# Altium schematic sheet LED_RESET_XCO.SchDoc
size 420 x 297 mm; Author: Лотов М.Д.; Address1: Address1; Address2: Address2; Address3: Address3; Address4: Address4; DocumentNumber: LED_RESET_XCO; SheetNumber: 5; SheetTotal: 5; Scale: 1:1; DocumentType: Схема электрическая принципиальная; FirstReferrence: АБВГ.123456.001
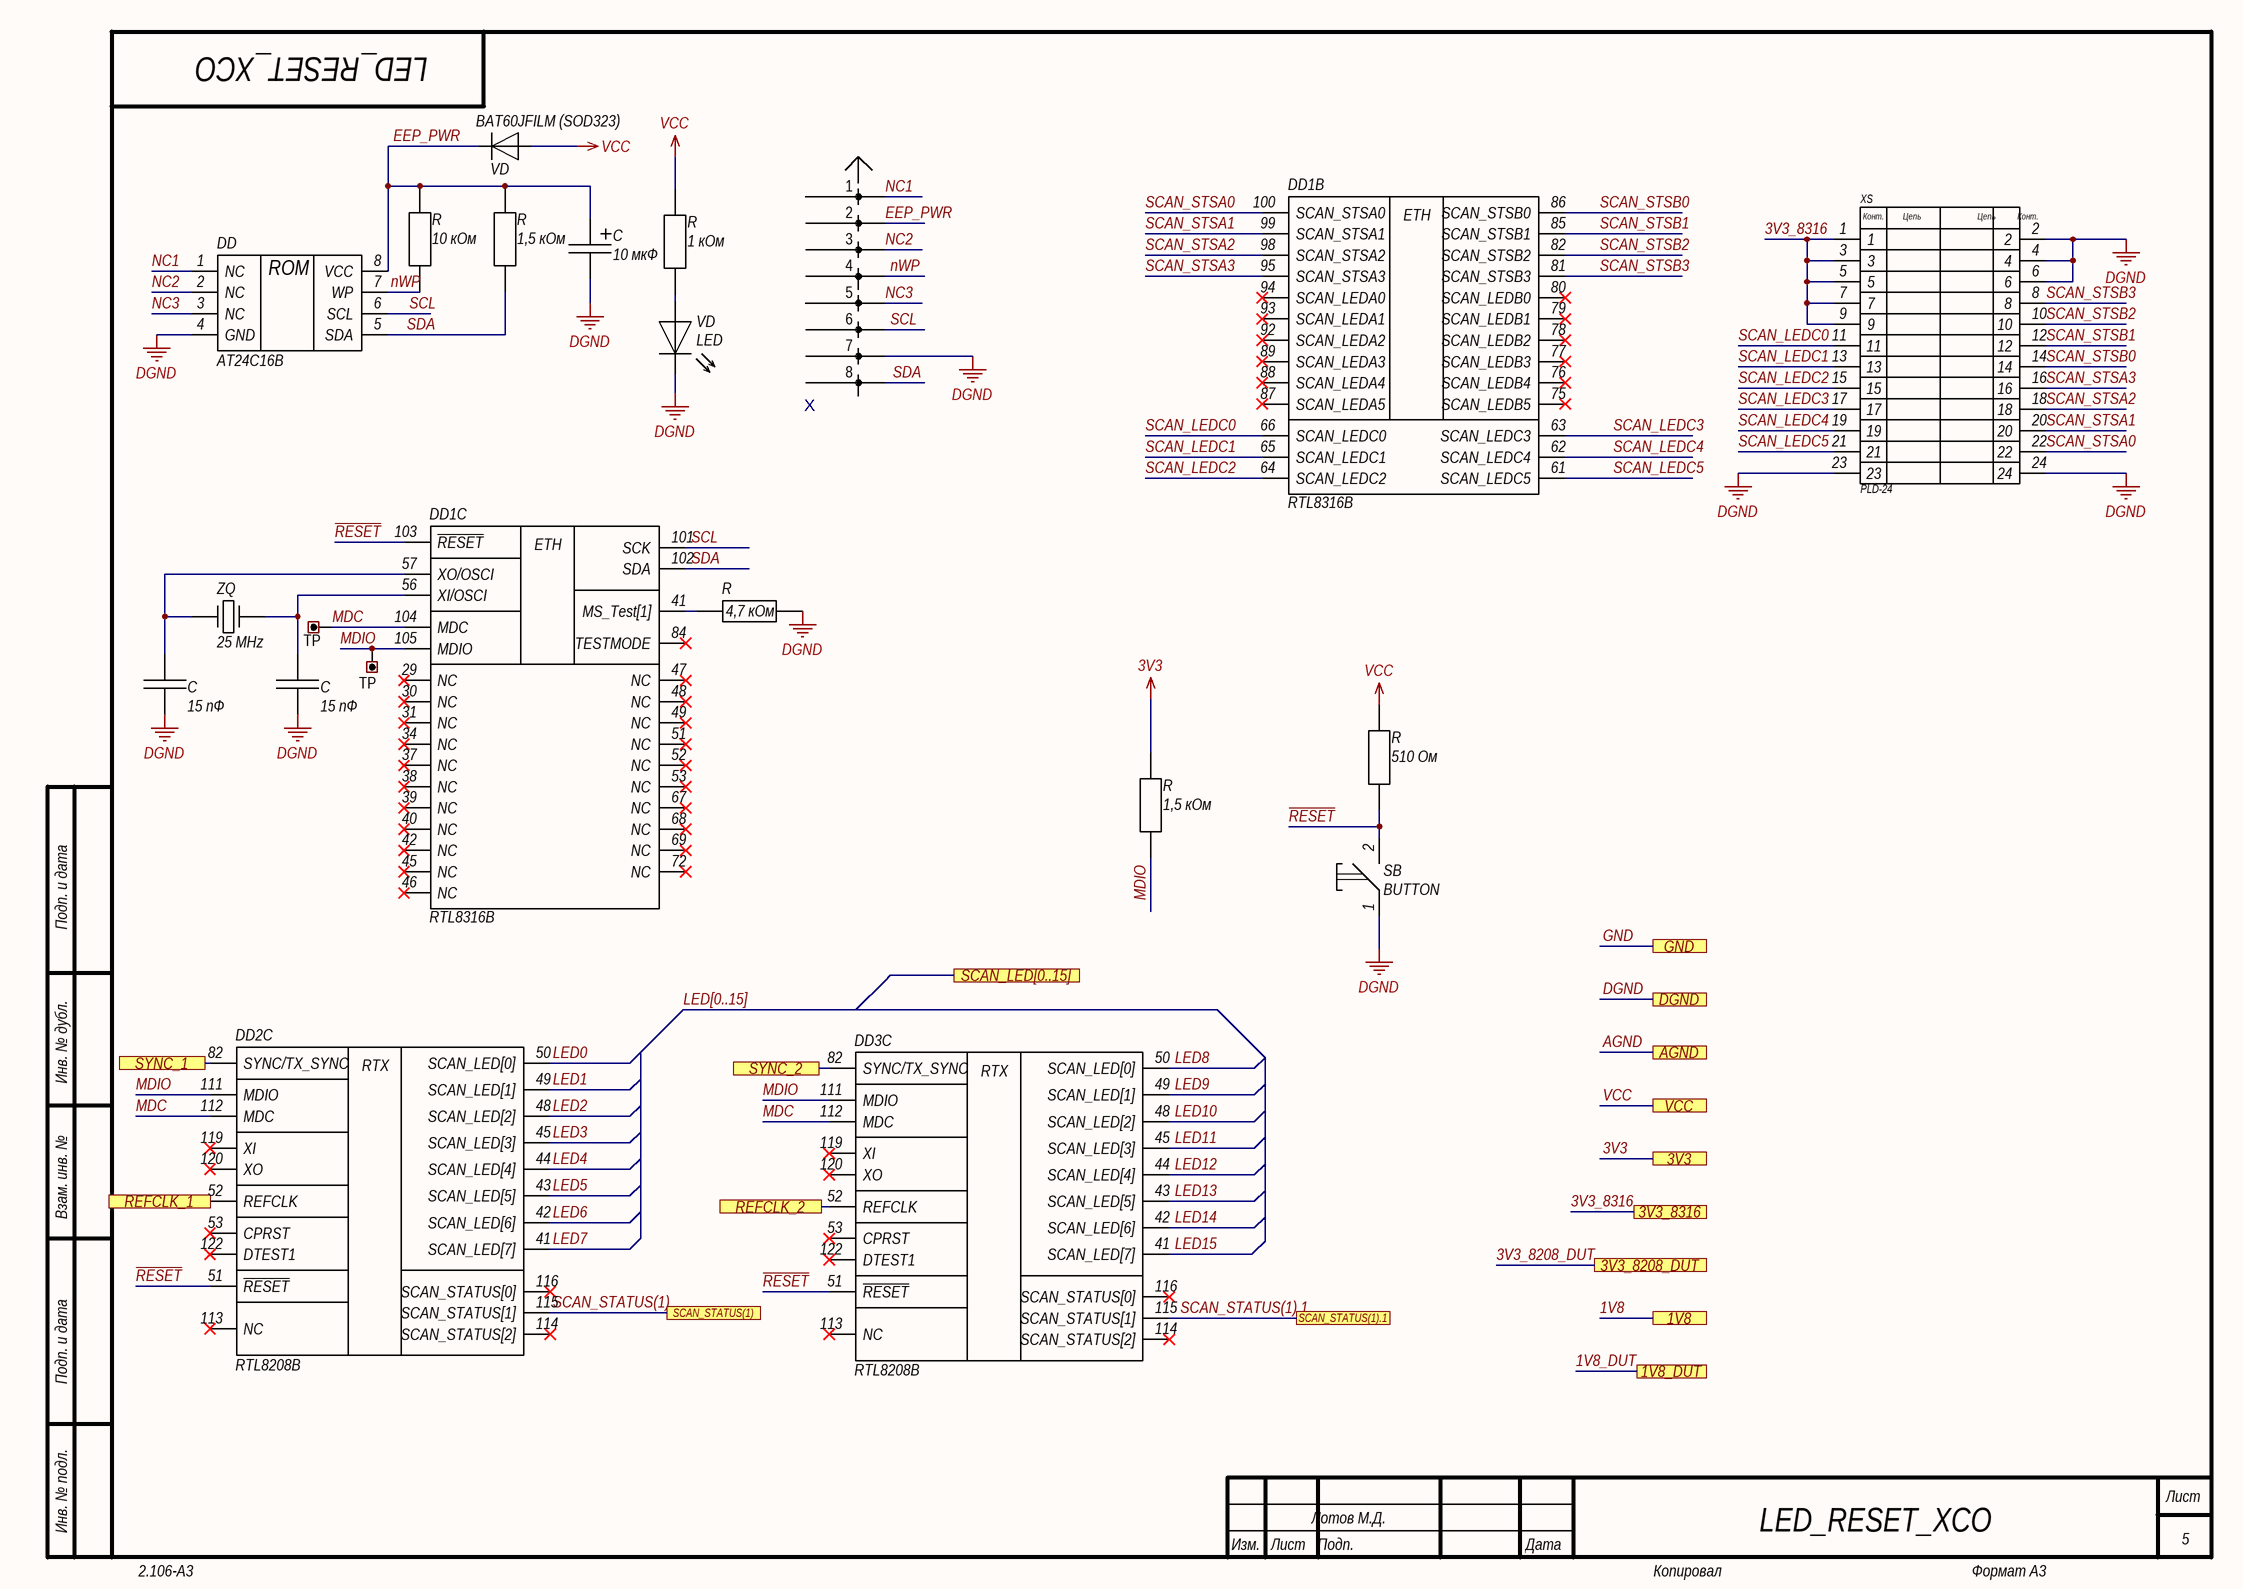
[diagram p0: LED_RESET_XCO.SchDoc]

## Parts
(Parts that share a designator on the sheet are numbered #1, #2 ... from top to bottom, then left to right.)
C#1  10 мкФ  [TECAP_type C]
C#2  15 пФ  [C0603]
C#3  15 пФ  [C0603]
DD  AT24C16B  [SOIC-8]
DD1  RTL8316B  [QFP-128_(14x20mm)_0.5mm_ZIF]  (parts B,C of 4)
DD2  RTL8208B  [QFP-128_14x20mm_0.5mm]  (part C of 4)
DD3  RTL8208B  [QFP-128_(14x20mm)_0.5mm_ZIF]  (part C of 4)
R#1  10 кОм  [R0603]
R#2  1,5 кОм  [R0603]
R#3  1 кОм  [R0603]
R#4  4,7 кОм  [R0603]
R#5  510 Ом  [R0603]
R#6  1,5 кОм  [R0603]
SB  BUTTON  [Buttom 2pin]
TP#1  (no value)  [PLS2-1]
TP#2  (no value)  [PLS2-1]
VD#1  BAT60JFILM (SOD323)  [SOD323]
VD#2  LED  [LED_0805]
X  PLD8-2,54  [PLD8-2,54]  (value not drawn)
XS  PLD-24  [PLD24_pitch_2.0mm]
ZQ  25 MHz  [XTAL_HC-49SM]

## Ports
1V8, 1V8_DUT, 3V3, 3V3_8208_DUT, 3V3_8316, AGND, DGND, GND, REFCLK_1, REFCLK_2, SCAN_LED[0..15], SCAN_STATUS(1), SCAN_STATUS(1).1, SYNC_1, SYNC_2, VCC

## Nets
3V3: R#6.2 ; port 3V3
DGND: C#1.2 C#2.2 C#3.2 DD.4(GND) R#4.2 SB.1 VD#2.1 X.7 XS.2 XS.4 XS.6 XS.23 XS.24 ; port DGND
VCC: R#3.2 R#5.2 VD#1.1(A) ; port VCC
1V8: port 1V8
1V8_DUT: port 1V8_DUT
3V3_8208_DUT: port 3V3_8208_DUT
3V3_8316: XS.1 XS.3 XS.5 XS.7 XS.9 ; port 3V3_8316
AGND: port AGND
EEP_PWR: C#1.1 DD.8(VCC) R#1.2 R#2.2 VD#1.2(K) X.2
GND: port GND
LED0: DD2.50(SCAN_LED[0])
LED1: DD2.49(SCAN_LED[1])
LED2: DD2.48(SCAN_LED[2])
LED3: DD2.45(SCAN_LED[3])
LED4: DD2.44(SCAN_LED[4])
LED5: DD2.43(SCAN_LED[5])
LED6: DD2.42(SCAN_LED[6])
LED7: DD2.41(SCAN_LED[7])
LED8: DD3.50(SCAN_LED[0])
LED9: DD3.49(SCAN_LED[1])
LED10: DD3.48(SCAN_LED[2])
LED11: DD3.45(SCAN_LED[3])
LED12: DD3.44(SCAN_LED[4])
LED13: DD3.43(SCAN_LED[5])
LED14: DD3.42(SCAN_LED[6])
LED15: DD3.41(SCAN_LED[7])
MDC: DD1.104(MDC) DD2.112(MDC) DD3.112(MDC) TP#1.1
MDIO: DD1.105(MDIO) DD2.111(MDIO) DD3.111(MDIO) R#6.1(x) TP#2.1
NC1: DD.1(NC) X.1
NC2: DD.2(NC) X.3
NC3: DD.3(NC) X.5
nWP: DD.7(WP) R#1.1(x) X.4
~{RESET}: DD1.103(~{RESET}) DD2.51(~{RESET}) DD3.51(~{RESET}) R#5.1(x) SB.2
REFCLK_1: DD2.52(REFCLK) ; port REFCLK_1
REFCLK_2: DD3.52(REFCLK) ; port REFCLK_2
SCAN_LEDC0: DD1.66(SCAN_LEDC0) XS.11
SCAN_LEDC1: DD1.65(SCAN_LEDC1) XS.13
SCAN_LEDC2: DD1.64(SCAN_LEDC2) XS.15
SCAN_LEDC3: DD1.63(SCAN_LEDC3) XS.17
SCAN_LEDC4: DD1.62(SCAN_LEDC4) XS.19
SCAN_LEDC5: DD1.61(SCAN_LEDC5) XS.21
SCAN_STATUS(1): DD2.115(SCAN_STATUS[1]) ; port SCAN_STATUS(1)
SCAN_STATUS(1).1: DD3.115(SCAN_STATUS[1]) ; port SCAN_STATUS(1).1
SCAN_STSA0: DD1.100(SCAN_STSA0) XS.22
SCAN_STSA1: DD1.99(SCAN_STSA1) XS.20
SCAN_STSA2: DD1.98(SCAN_STSA2) XS.18
SCAN_STSA3: DD1.95(SCAN_STSA3) XS.16
SCAN_STSB0: DD1.86(SCAN_STSB0) XS.14
SCAN_STSB1: DD1.85(SCAN_STSB1) XS.12
SCAN_STSB2: DD1.82(SCAN_STSB2) XS.10
SCAN_STSB3: DD1.81(SCAN_STSB3) XS.8
SCL: DD.6(SCL) DD1.101(SCK) X.6
SDA: DD.5(SDA) DD1.102(SDA) R#2.1(x) X.8
SYNC_1: DD2.82(SYNC/TX_SYNC) ; port SYNC_1
SYNC_2: DD3.82(SYNC/TX_SYNC) ; port SYNC_2
NetC#2_1: C#2.1 DD1.57(XO/OSCI) ZQ.2
NetC#3_1: C#3.1 DD1.56(XI/OSCI) ZQ.1
NetDD1_41: DD1.41(MS_Test[1]) R#4.1(x)
NetR#3_1: R#3.1(x) VD#2.2

Not connected (* = marked no-connect by the designer): DD1 29(NC)* 30(NC)* 31(NC)* 34(NC)* 37(NC)* 38(NC)* 39(NC)* 40(NC)* 42(NC)* 45(NC)* 46(NC)* 47(NC)* 48(NC)* 49(NC)* 51(NC)* 52(NC)* 53(NC)* 67(NC)* 68(NC)* 69(NC)* 72(NC)* 75(SCAN_LEDB5)* 76(SCAN_LEDB4)* 77(SCAN_LEDB3)* 78(SCAN_LEDB2)* 79(SCAN_LEDB1)* 80(SCAN_LEDB0)* 84(TESTMODE)* 87(SCAN_LEDA5)* 88(SCAN_LEDA4)* 89(SCAN_LEDA3)* 92(SCAN_LEDA2)* 93(SCAN_LEDA1)* 94(SCAN_LEDA0)*; DD2 53(CPRST)* 113(NC)* 114(SCAN_STATUS[2])* 116(SCAN_STATUS[0])* 119(XI)* 120(XO)* 122(DTEST1)*; DD3 53(CPRST)* 113(NC)* 114(SCAN_STATUS[2])* 116(SCAN_STATUS[0])* 119(XI)* 120(XO)* 122(DTEST1)*

## Buses and harness runs
bus LED[0..15] = port SCAN_LED[0..15]

## Notes on the sheet
- Подп. и дата
- Инв. № дубл.
- Взам. инв. №
- Инв. № подл.
- Изм.
- Лист
- Подп.
- Дата
- 2.106-A3
- Копировал
- Формат А3
- (in symbol AT24C16B) ROM
- (in symbol PLD-24) Конт.; Цепь
- (in symbol RTL8208B, part C) RTX
- (in symbol RTL8316B, part B) ETH
- (in symbol RTL8316B, part C) ETH

## Library data of the parts
C#1 = T_Cap_SMD
C#2 C#3 = Capacitance_SMD
R#1-R#6 = Resistor_SMD
SB = BUTTON: 3x6x2.5 / 4.5x6.5
TP#1 TP#2 = Connector_Test_Point: Manufacturer: Keystone; ValueManufacturerPartNumber: Test point, Keystone, 5001; PartNumber: 5001; TypeConnector: Test point; HelpURL: https://www.digikey.com/product-detail/en/keystone-electronics/5001/36-5001-ND/255327
VD#1 = BAT60JFILM (SOD323): ComponentHeigt: 0.75; Leadform: в отверстия; Firme: Kingbright; NN: 24003000; KIND: Светодиод L-1154GD Kingbright; Component Link: *; ClassName: *
X = PLD8-2,54: ComponentHeigt: 5.5; Name: Вилка; Specification: Вилка PLD2-2 *; Typ: PLD2-2; ClassName: *; Component Link: *; ComponentWeigt: *; Firme: *; Leadform: *; NN: *; KIND: *
ZQ = XTAL_HC-49S